# Altium schematic sheet STPMotorControl4_1.SchDoc
size A4; SheetNumber: 5; SheetTotal: 6
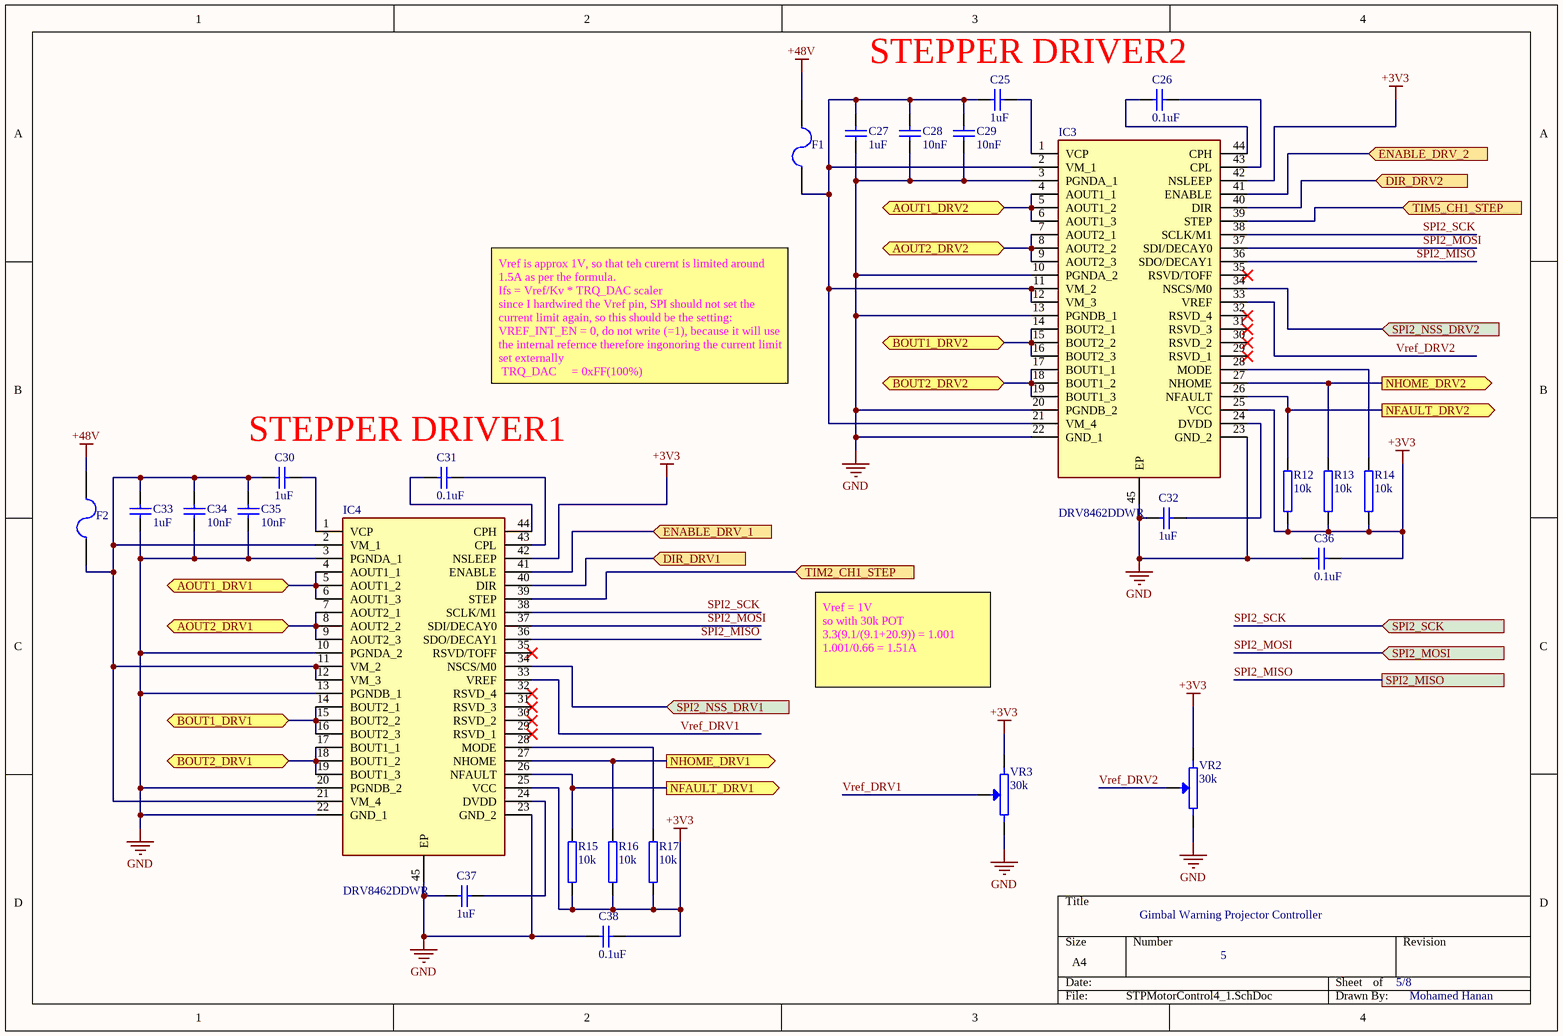
[diagram p0: STPMotorControl4_1.SchDoc]

## Parts
C25  1uF  [CAP_0805]
C26  0.1uF  [CAP_1206]
C27  1uF  [CAP_0805]
C28  10nF  [CAP_0805]
C29  10nF  [CAP_0805]
C30  1uF  [CAP_0805]
C31  0.1uF  [CAP_1206]
C32  1uF  [CAP_0805]
C33  1uF  [CAP_0805]
C34  10nF  [CAP_0805]
C35  10nF  [CAP_0805]
C36  0.1uF  [CAP_1206]
C37  1uF  [CAP_0805]
C38  0.1uF  [CAP_1206]
F1  1206L035/16YR  [MC36207]  (value not drawn)
F2  1206L035/16YR  [MC36207]  (value not drawn)
IC3  DRV8462DDWR  [SOP64P810X120-45N]
IC4  DRV8462DDWR  [SOP64P810X120-45N]
R12  10k  [RES_0805]
R13  10k  [RES_0805]
R14  10k  [RES_0805]
R15  10k  [RES_0805]
R16  10k  [RES_0805]
R17  10k  [RES_0805]
VR2  30k  [3362S]
VR3  30k  [3362S]

## Ports
AOUT1_DRV1 (bidir, see STPMotorConnections[2A], STPMotorControl7_1[1C]), AOUT1_DRV2 (bidir, see STPMotorConnections[2A], STPMotorControl7_1[1D]), AOUT2_DRV1 (bidir, see STPMotorConnections[2A], STPMotorControl7_1[1C]), AOUT2_DRV2 (bidir, see STPMotorConnections[2A], STPMotorControl7_1[1D]), BOUT1_DRV1 (bidir, see STPMotorConnections[2A], STPMotorControl7_1[1C]), BOUT1_DRV2 (bidir, see STPMotorConnections[2A], STPMotorControl7_1[1C]), BOUT2_DRV1 (bidir, see STPMotorConnections[2A], STPMotorControl7_1[1C]), BOUT2_DRV2 (bidir, see STPMotorConnections[2A], STPMotorControl7_1[1C]), DIR_DRV1 (in, see STPMotorConnections[1A], STPMotorControl_1[3C]), DIR_DRV2 (in, see STPMotorConnections[1A], STPMotorControl_1[3C]), ENABLE_DRV_1 (in), ENABLE_DRV_2 (in), NFAULT_DRV1 (out, see STPMotorConnections[2B], STPMotorControl_1[1B]), NFAULT_DRV2 (out, see STPMotorConnections[2B], STPMotorControl_1[1B]), NHOME_DRV1 (out, see STPMotorConnections[2B], STPMotorControl_1[2D]), NHOME_DRV2 (out, see STPMotorConnections[2B], STPMotorControl_1[2D]), SPI2_MISO (see STPMotorConnections[1B], STPMotorControl_1[3C]), SPI2_MOSI (in, see STPMotorConnections[1B], STPMotorControl_1[3B]), SPI2_NSS_DRV1 (in, see STPMotorConnections[2B], STPMotorControl_1[3A]), SPI2_NSS_DRV2 (in, see STPMotorConnections[2B], STPMotorControl_1[3A]), SPI2_SCK (in, see STPMotorConnections[1B], STPMotorControl_1[3B]), TIM2_CH1_STEP (in, see STPMotorConnections[1A], STPMotorControl_1[3B]), TIM5_CH1_STEP (in, see STPMotorConnections[1A], STPMotorControl_1[3A])

## Nets
+3V3: C36.2 C38.2 IC3.25(VCC) IC3.42(NSLEEP) IC4.25(VCC) IC4.42(NSLEEP) R12.1 R13.1 R14.1 R15.1 R16.1 R17.1 VR2.1(TOP) VR3.1(TOP)
+48V: F1.2 F2.2
GND: C27.1 C28.1 C29.1 C32.1 C33.1 C34.1 C35.1 C36.1 C37.1 C38.1 IC3.3(PGNDA_1) IC3.10(PGNDA_2) IC3.13(PGNDB_1) IC3.20(PGNDB_2) IC3.22(GND_1) IC3.23(GND_2) IC3.45(EP) IC4.3(PGNDA_1) IC4.10(PGNDA_2) IC4.13(PGNDB_1) IC4.20(PGNDB_2) IC4.22(GND_1) IC4.23(GND_2) IC4.45(EP) VR2.2(BOT) VR3.2(BOT)
AOUT1_DRV1: IC4.4(AOUT1_1) IC4.5(AOUT1_2) IC4.6(AOUT1_3) ; port AOUT1_DRV1
AOUT1_DRV2: IC3.4(AOUT1_1) IC3.5(AOUT1_2) IC3.6(AOUT1_3) ; port AOUT1_DRV2
AOUT2_DRV1: IC4.7(AOUT2_1) IC4.8(AOUT2_2) IC4.9(AOUT2_3) ; port AOUT2_DRV1
AOUT2_DRV2: IC3.7(AOUT2_1) IC3.8(AOUT2_2) IC3.9(AOUT2_3) ; port AOUT2_DRV2
BOUT1_DRV1: IC4.14(BOUT2_1) IC4.15(BOUT2_2) IC4.16(BOUT2_3) ; port BOUT1_DRV1
BOUT1_DRV2: IC3.14(BOUT2_1) IC3.15(BOUT2_2) IC3.16(BOUT2_3) ; port BOUT1_DRV2
BOUT2_DRV1: IC4.17(BOUT1_1) IC4.18(BOUT1_2) IC4.19(BOUT1_3) ; port BOUT2_DRV1
BOUT2_DRV2: IC3.17(BOUT1_1) IC3.18(BOUT1_2) IC3.19(BOUT1_3) ; port BOUT2_DRV2
DIR_DRV1: IC4.40(DIR) ; port DIR_DRV1
DIR_DRV2: IC3.40(DIR) ; port DIR_DRV2
ENABLE_DRV_1: IC4.41(ENABLE) ; port ENABLE_DRV_1
ENABLE_DRV_2: IC3.41(ENABLE) ; port ENABLE_DRV_2
NFAULT_DRV1: IC4.26(NFAULT) R15.2 ; port NFAULT_DRV1
NFAULT_DRV2: IC3.26(NFAULT) R12.2 ; port NFAULT_DRV2
NHOME_DRV1: IC4.27(NHOME) R16.2 ; port NHOME_DRV1
NHOME_DRV2: IC3.27(NHOME) R13.2 ; port NHOME_DRV2
SPI2_MISO: IC3.36(SDO/DECAY1) IC4.36(SDO/DECAY1) ; port SPI2_MISO
SPI2_MOSI: IC3.37(SDI/DECAY0) IC4.37(SDI/DECAY0) ; port SPI2_MOSI
SPI2_NSS_DRV1: IC4.34(NSCS/M0) ; port SPI2_NSS_DRV1
SPI2_NSS_DRV2: IC3.34(NSCS/M0) ; port SPI2_NSS_DRV2
SPI2_SCK: IC3.38(SCLK/M1) IC4.38(SCLK/M1) ; port SPI2_SCK
TIM2_CH1_STEP: IC4.39(STEP) ; port TIM2_CH1_STEP
TIM5_CH1_STEP: IC3.39(STEP) ; port TIM5_CH1_STEP
Vref_DRV1: IC4.33(VREF) VR3.W(TAP)
Vref_DRV2: IC3.33(VREF) VR2.W(TAP)
NetC25_1: C25.1 C27.2 C28.2 C29.2 F1.1 IC3.2(VM_1) IC3.11(VM_2) IC3.12(VM_3) IC3.21(VM_4)
NetC25_2: C25.2 IC3.1(VCP)
NetC26_1: C26.1 IC3.44(CPH)
NetC26_2: C26.2 IC3.43(CPL)
NetC30_1: C30.1 C33.2 C34.2 C35.2 F2.1 IC4.2(VM_1) IC4.11(VM_2) IC4.12(VM_3) IC4.21(VM_4)
NetC30_2: C30.2 IC4.1(VCP)
NetC31_1: C31.1 IC4.44(CPH)
NetC31_2: C31.2 IC4.43(CPL)
NetC32_2: C32.2 IC3.24(DVDD)
NetC37_2: C37.2 IC4.24(DVDD)
NetIC3_28: IC3.28(MODE) R14.2
NetIC4_28: IC4.28(MODE) R17.2

Not connected (* = marked no-connect by the designer): IC3 29(RSVD_1)* 30(RSVD_2)* 31(RSVD_3)* 32(RSVD_4)* 35(RSVD/TOFF)*; IC4 29(RSVD_1)* 30(RSVD_2)* 31(RSVD_3)* 32(RSVD_4)* 35(RSVD/TOFF)*

## Notes on the sheet
- STEPPER DRIVER2
- Vref is approx 1V, so that teh curernt is limited around 1.5A as per the formula.
  Ifs = Vref/Kv * TRQ_DAC scaler
  since I hardwired the Vref pin, SPI should not set the current limit again, so this should be the setting:
  VREF_INT_EN = 0, do not write (=1), because it will use the internal refernce therefore ingonoring the current limit set externally
  TRQ_DAC     = 0xFF(100%)
- STEPPER DRIVER1
- Vref = 1V
  so with 30k POT
  3.3(9.1/(9.1+20.9)) = 1.001
  1.001/0.66 = 1.51A
- Gimbal Warning Projector Controller
- 5
- 5/8
- Mohamed Hanan

## Library data of the parts
C25 C27-C30 C32-C35 C37 = CAPN 0805: Non Polarized Capacitor, SMD, 0805
C26 C31 C36 C38 = CAPN 1206: Non Polarized Capacitor, SMD, 1206
F1 F2 = 1206L035/16YR: Fuse, PTC Reset, 350mA Hold, 750mA Tripping, 16v; Supplier 1: Element14; Supplier Part Number 1: 1822203
IC3 IC4 = DRV8462DDWR: Integrated Circuit; Manufacturer_Name: Texas Instruments; Datasheet Link: https://www.ti.com/lit/gpn/drv8462; Height: 1.2mm; Manufacturer_Part_Number: DRV8462DDWR; Mouser Part Number: 595-DRV8462DDWR; Mouser Price/Stock: https://www.mouser.co.uk/ProductDetail/Texas-Instruments/DRV8462DDWR?qs=rQFj71Wb1eVexvYNsDfnvA%3D%3D; Arrow Part Number: DRV8462DDWR; Arrow Price/Stock: https://www.arrow.com/en/products/drv8462ddwr/texas-instruments?utm_currency=USD&region=nac
R12-R17 = Resistor 0805: Resistor, SMD, 0805
VR2 VR3 = 3362S-1-202LF: 3362S Series, 1/4 ” Square  Potentiometer, 2k, 10%, 0.5 Watts, 1Turn; Supplier 1: Farnell; Supplier Part Number 1: 2321842